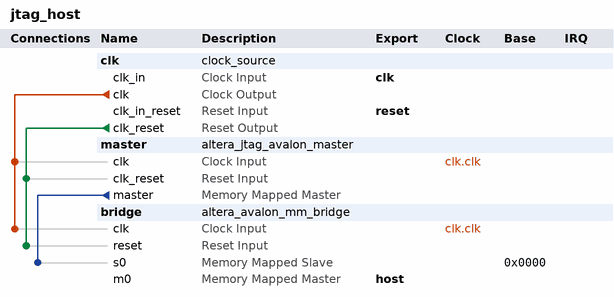
[diagram p0: system contents]
# Platform Designer (Qsys) system jtag_host, Cyclone V 5CSXFC6D6F31C6
# Parameters at their usual value, and those the tool derives, are not listed.
package require -exact qsys 21.1
create_system jtag_host
set_project_property DEVICE_FAMILY {Cyclone V}
set_project_property DEVICE 5CSXFC6D6F31C6

add_instance clk clock_source 21.1
set_instance_parameter_value clk clockFrequency 25000000
set_instance_parameter_value clk resetSynchronousEdges DEASSERT

add_instance master altera_jtag_avalon_master 21.1

add_instance bridge altera_avalon_mm_bridge 21.1
set_instance_parameter_value bridge ADDRESS_UNITS SYMBOLS
set_instance_parameter_value bridge ADDRESS_WIDTH 19
set_instance_parameter_value bridge DATA_WIDTH 32
set_instance_parameter_value bridge MAX_PENDING_RESPONSES 4
set_instance_parameter_value bridge USE_AUTO_ADDRESS_WIDTH 0

# connections
add_connection clk.clk bridge.clk clock
add_connection clk.clk master.clk clock
add_connection clk.clk_reset bridge.reset reset
add_connection clk.clk_reset master.clk_reset reset
add_connection master.master bridge.s0 avalon
set_connection_parameter_value master.master/bridge.s0 baseAddress 0x0000

# exported interfaces
add_interface clk clock sink
set_interface_property clk EXPORT_OF clk.clk_in
add_interface host avalon master
set_interface_property host EXPORT_OF bridge.m0
add_interface reset reset sink
set_interface_property reset EXPORT_OF clk.clk_in_reset

set_interconnect_requirement {$system} qsys_mm.clockCrossingAdapter HANDSHAKE
set_interconnect_requirement {$system} qsys_mm.enableEccProtection FALSE
set_interconnect_requirement {$system} qsys_mm.insertDefaultSlave FALSE
set_interconnect_requirement {$system} qsys_mm.maxAdditionalLatency 1

save_system jtag_host.qsys
